# Altium schematic sheet MCU_Peripherals.SchDoc: MCU Peripherals
size A4; DocumentNumber: 4; SheetNumber: 4; SheetTotal: 17
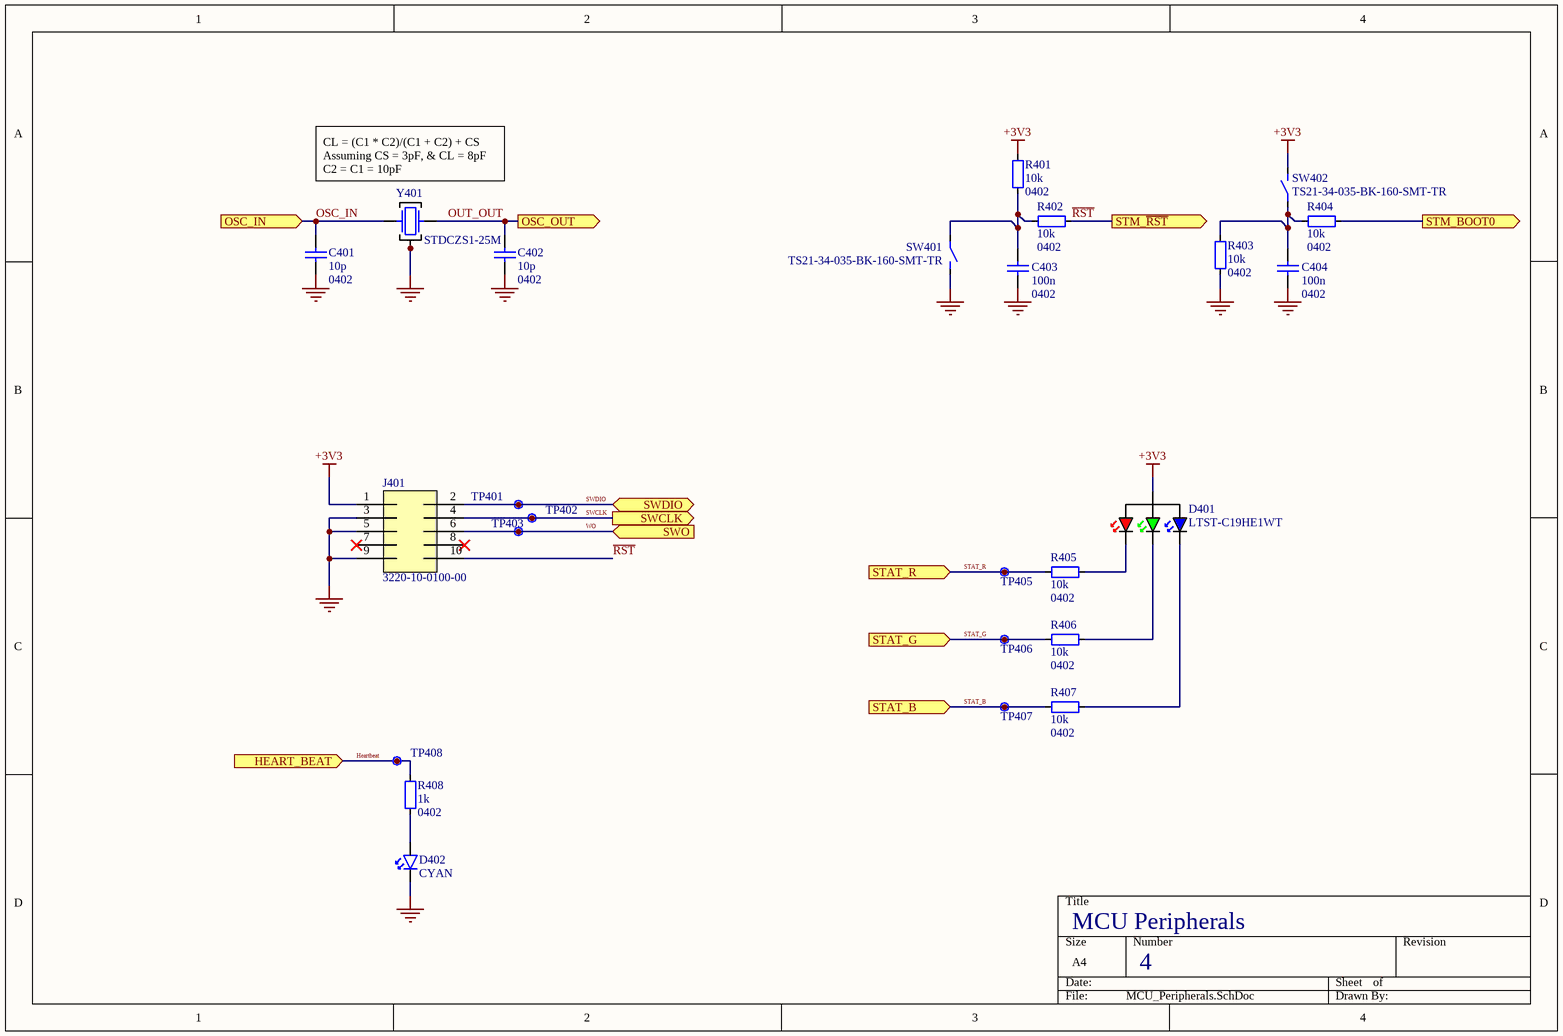
[diagram p0: MCU_Peripherals.SchDoc]

## Parts
C401  10p  Footprint: 0402  [CAP_0402_B]
C402  10p  Footprint: 0402  [CAP_0402_B]
C403  100n  Footprint: 0402  [CAP_0402_B]
C404  100n  Footprint: 0402  [CAP_0402_B]
D401  LTST-C19HE1WT  [LTST-C19HE1WT]
D402  CYAN  [SMLD12E3N1WT86]
J401  3220-10-0100-00  [3220-10-0100-00]
R401  10k  Footprint: 0402  [RES_0402_A]
R402  10k  Footprint: 0402  [RES_0402_A]
R403  10k  Footprint: 0402  [RES_0402_A]
R404  10k  Footprint: 0402  [RES_0402_A]
R405  10k  Footprint: 0402  [RES_0402_A]
R406  10k  Footprint: 0402  [RES_0402_A]
R407  10k  Footprint: 0402  [RES_0402_A]
R408  1k  Footprint: 0402  [RES_0402_A]
SW401  TS21-34-035-BK-160-SMT-TR  [TS21-34-035-BK-160-SMT-TR]
SW402  TS21-34-035-BK-160-SMT-TR  [TS21-34-035-BK-160-SMT-TR]
TP401  Net  [Unlabelled Testpoint]  (value not drawn)
TP402  Net  [Unlabelled Testpoint]  (value not drawn)
TP403  Net  [Unlabelled Testpoint]  (value not drawn)
TP405  Net  [Unlabelled Testpoint]  (value not drawn)
TP406  Net  [Unlabelled Testpoint]  (value not drawn)
TP407  Net  [Unlabelled Testpoint]  (value not drawn)
TP408  Net  [Unlabelled Testpoint]  (value not drawn)
Y401  STDCZS1-25M  [STDCZS1-25M]

## Ports
HEART_BEAT (in, see MCU[1D]), OSC_IN (in, see MCU[1D]), OSC_OUT (out, see MCU[1D]), STAT_B (in, see MCU[1D]), STAT_G (in, see MCU[1D]), STAT_R (in, see MCU[1D]), STM_BOOT0 (out, see MCU[1D], MCU_Power[2B]), STM_~{RST} (out, see MCU[1D], MCU_Power[2B]), SWCLK (out, see MCU[1D]), SWDIO (bidir, see MCU[1D]), SWO (in, see MCU[1D])

## Nets
+3V3: D401.4 J401.1 R401.2(a) SW402.2
GND: C401.2 C402.2 C403.2 C404.2 D402.2 J401.3 J401.5 J401.9 R403.1(a) SW401.2 Y401.2(GND) Y401.4(GND)
Heartbeat: R408.1(a) TP408.1 ; port HEART_BEAT
OSC_IN: C401.1 Y401.3(IO) ; port OSC_IN
OUT_OUT: C402.1 Y401.1(IO) ; port OSC_OUT
~{RST}: J401.10 R402.2(a) ; port STM_~{RST}
STAT_B: R407.1(a) TP407.1 ; port STAT_B
STAT_G: R406.1(a) TP406.1 ; port STAT_G
STAT_R: R405.1(a) TP405.1 ; port STAT_R
STM_BOOT0: R404.2(a) ; port STM_BOOT0
SWCLK: J401.4 TP402.1 ; port SWCLK
SWDIO: J401.2 TP401.1 ; port SWDIO
WO: J401.6 TP403.1 ; port SWO
NetC403_1: C403.1 R401.1(a) R402.1(a) SW401.1
NetC404_1: C404.1 R403.2(a) R404.1(a) SW402.1
NetD401_1: D401.1 R405.2(a)
NetD401_2: D401.2 R406.2(a)
NetD401_3: D401.3 R407.2(a)
NetD402_1: D402.1 R408.2(a)

Not connected (* = marked no-connect by the designer): J401 7(2)* 8(2)*

## Notes on the sheet
- (near Y401) CL = (C1 * C2)/(C1 + C2) + CS
  Assuming CS = 3pF, & CL = 8pF
  C2 = C1 = 10pF

## Library data of the parts
C401-C404 = CAP_0402: 0402 SMD Capacitor
D401 = LTST-C19HE1WT: Red, Green, Blue (RGB) 624nm Red, 525nm Green, 470nm Blue LED Indication - Discrete 2.1V Red, 3.35V Green, 3.35V Blue 0606 (1616 Metric); Supplier 1: Arrow Electronics; Supplier Part Number 1: LTST-C19HE1WT
D402 = LED_Generic: Part Number: SMLD12E3N1WT86; Supplier 1: DigiKey; Supplier Part Number 1: SMLD12E3N1WT86CT-ND
J401 = 3220-10-0100-00: Connector Header Through Hole 10 position 0.050" (1.27mm); Supplier 1: DigiKey; Supplier Part Number 1: 1175-1627-ND
R401-R408 = RES_0402: 0402 SMD Resistor
SW401 SW402 = TS21-34-035-BK-160-SMT-TR: Tactile Switch SPST-NO Top Actuated Surface Mount; Supplier 1: DigiKey; Supplier Part Number 1: 2223-TS21-34-035-BK-160-SMT-TRDKR-ND
TP401-TP403 TP405-TP408 = Unlabelled Testpoint: Symbol for an unlabelled testpoint
Y401 = STDCZS1-25M: 25 MHz ±15ppm Crystal 8pF 80 Ohms 4-SMD, No Lead; Supplier 1: DigiKey; Supplier Part Number 1: 644-STDCZS1-25MDKR-ND